# Altium schematic sheet B.SchDoc
size A4
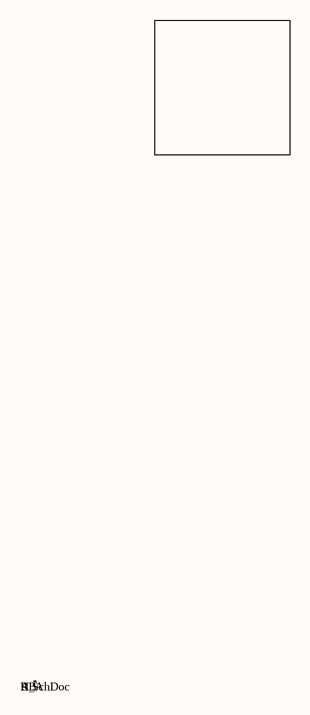
[diagram p0: B.SchDoc]

## Parts
RB  (no value)

## Sub-sheets
U_A = A.SchDoc: no entries

## Nets

Not connected (* = marked no-connect by the designer): RB 1(A)

## Library data of the parts
RB = RES